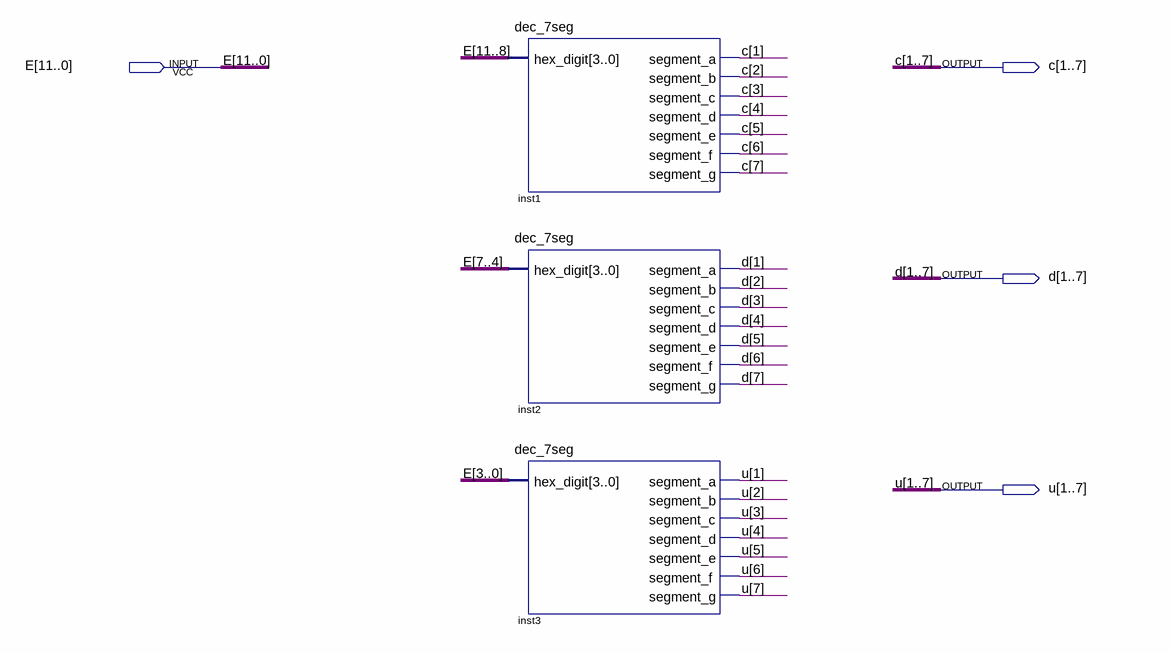
[diagram p0: schematic sheet]
// Quartus schematic affich3digit.bdf as structural Verilog: 3 symbols, 4 pins
module affich3digit (
  input  [11:0] E,
  output [1:7] c,
  output [1:7] d,
  output [1:7] u
);

  dec_7seg inst1 (
    .hex_digit(E[11:8]), .segment_a(c[1]), .segment_b(c[2]), .segment_c(c[3]), .segment_d(c[4]),
    .segment_e(c[5]), .segment_f(c[6]), .segment_g(c[7]));
  dec_7seg inst2 (
    .hex_digit(E[7:4]), .segment_a(d[1]), .segment_b(d[2]), .segment_c(d[3]), .segment_d(d[4]),
    .segment_e(d[5]), .segment_f(d[6]), .segment_g(d[7]));
  dec_7seg inst3 (
    .hex_digit(E[3:0]), .segment_a(u[1]), .segment_b(u[2]), .segment_c(u[3]), .segment_d(u[4]),
    .segment_e(u[5]), .segment_f(u[6]), .segment_g(u[7]));
endmodule
